# Altium schematic sheet WireCuttingSampling.SchDoc
size A3
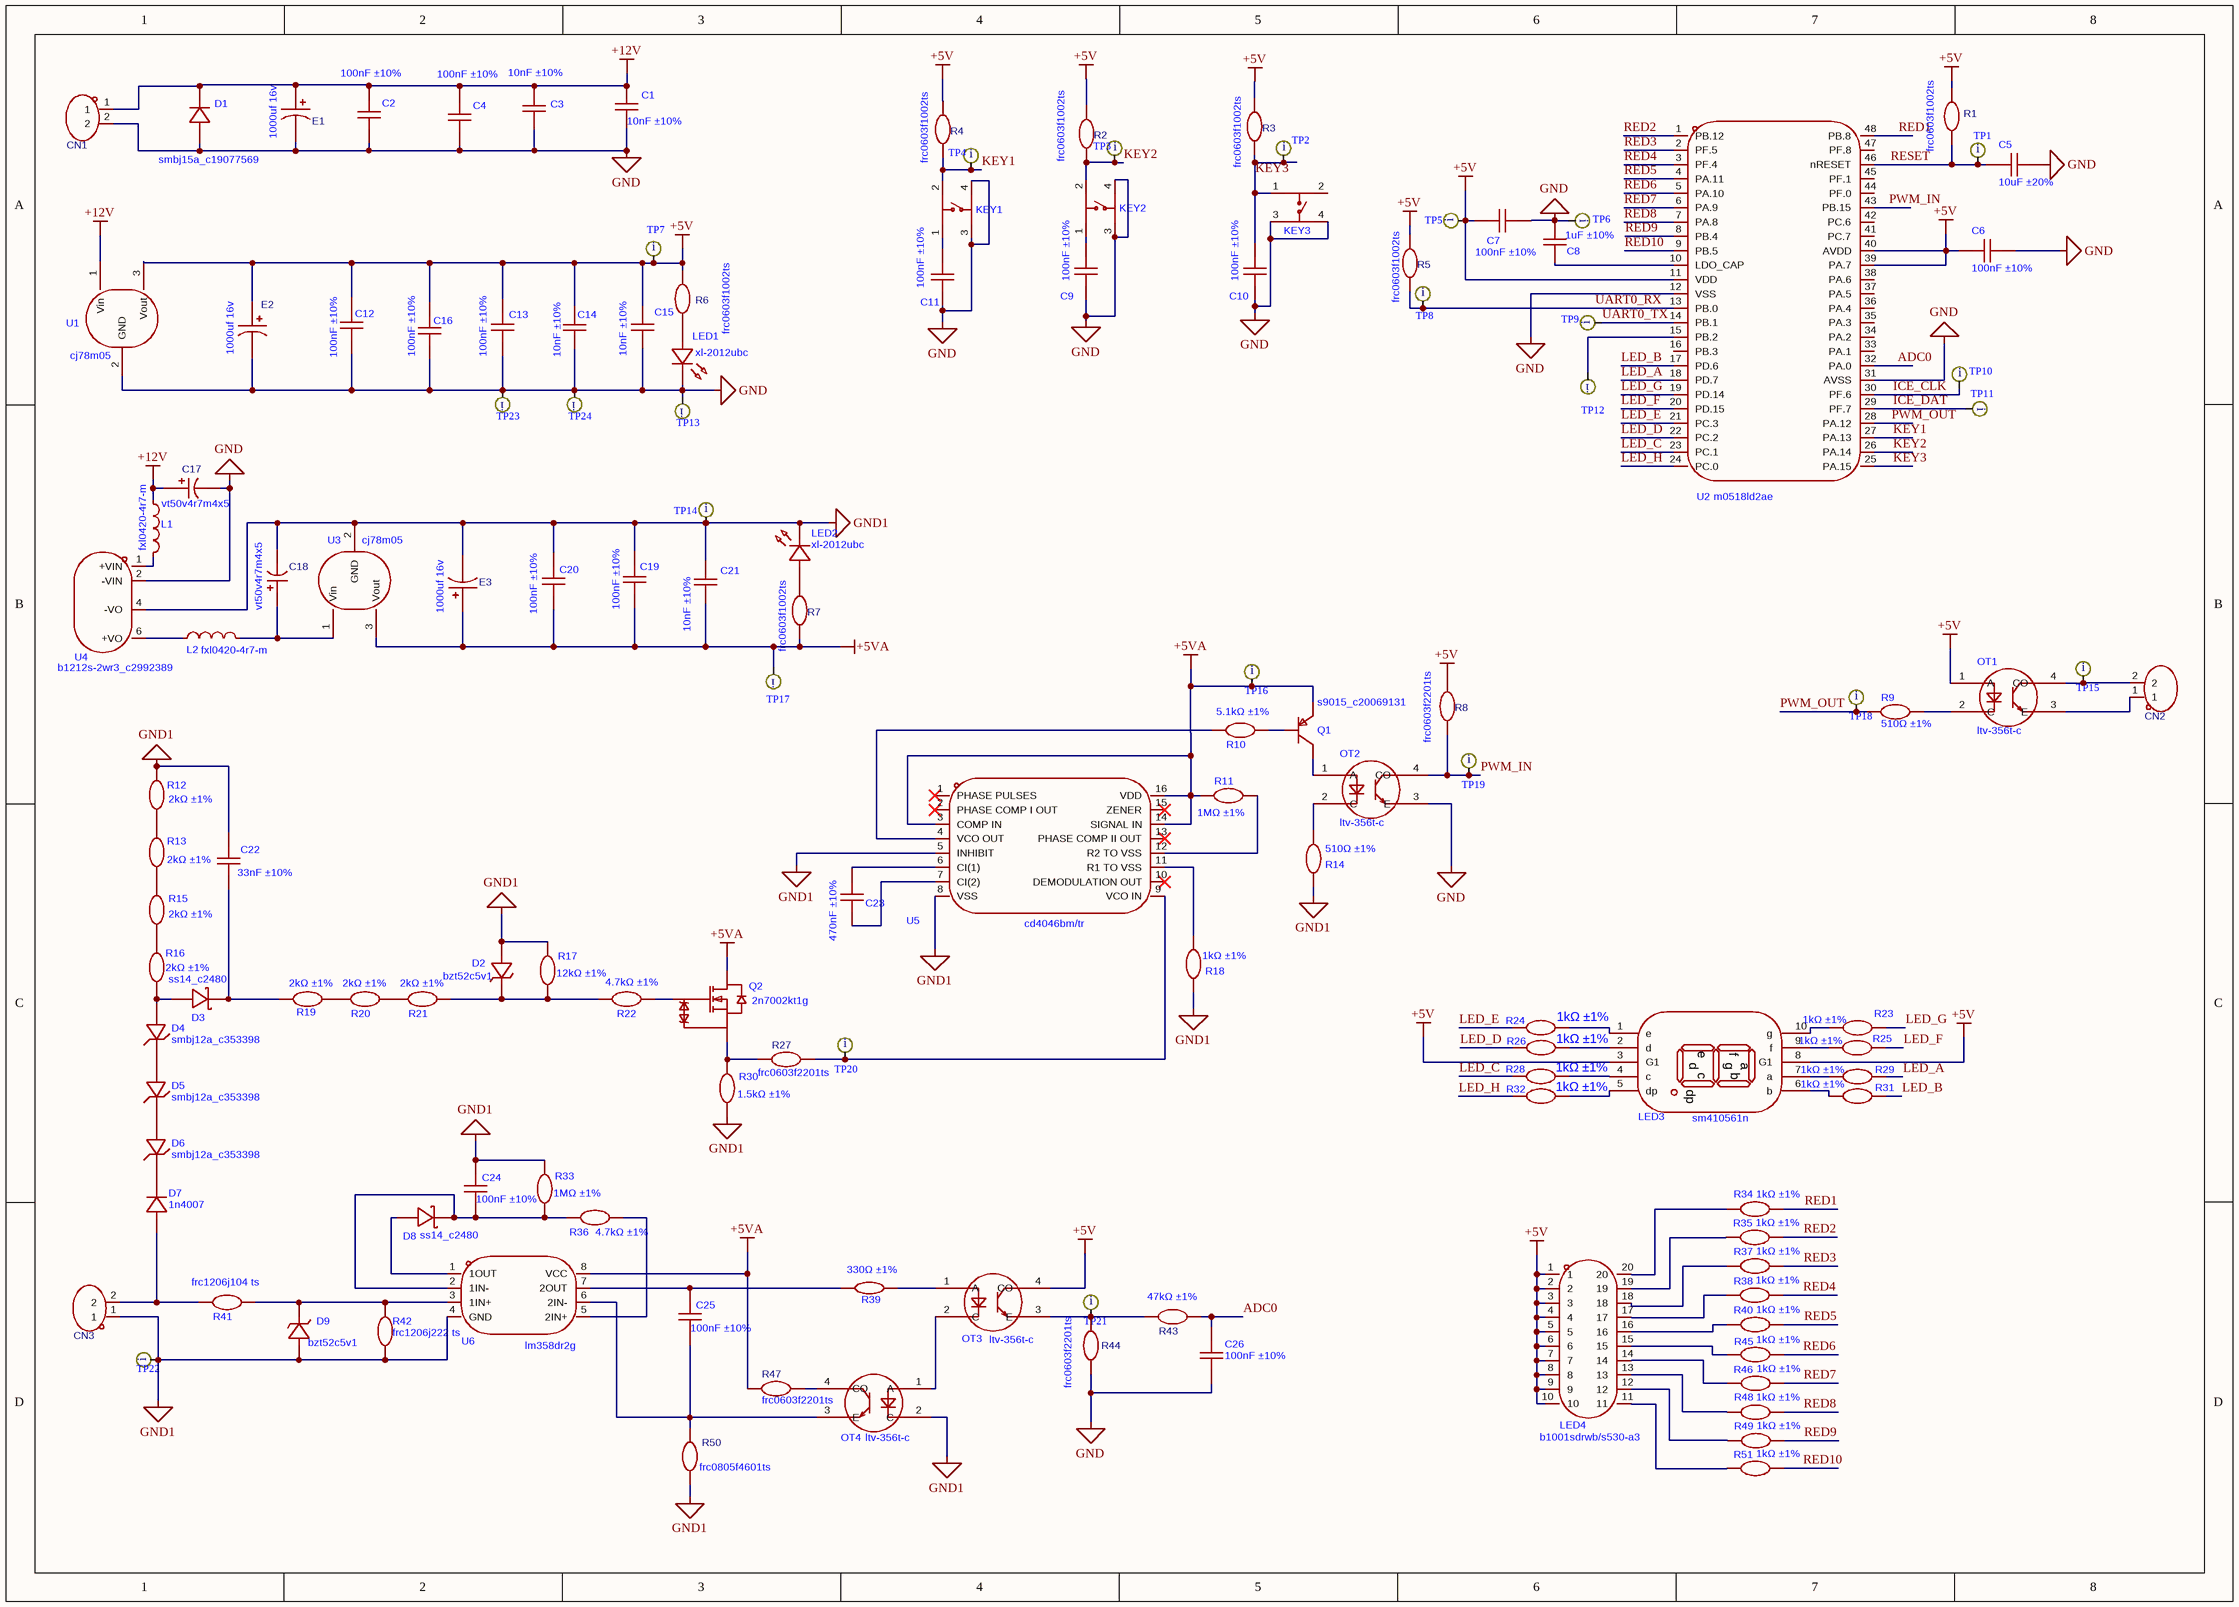
[diagram p0: WireCuttingSampling.SchDoc]

## Parts
C1  10nF ±10%  [C0603]
C2  100nF ±10%  [C0603]
C3  10nF ±10%  [C0603]
C4  100nF ±10%  [C0603]
C5  10uF ±20%  [C0603]
C6  100nF ±10%  [C0603]
C7  100nF ±10%  [C0603]
C8  1uF ±10%  [C0603]
C9  100nF ±10%  [C0603]
C10  100nF ±10%  [C0603]
C11  100nF ±10%  [C0603]
C12  100nF ±10%  [C0603]
C13  100nF ±10%  [C0603]
C14  10nF ±10%  [C0603]
C15  10nF ±10%  [C0603]
C16  100nF ±10%  [C0603]
C17  vt50v4r7m4x5  [CAP-SMD_BD4.0-L4.3-W4.3-LS5.0-FD]
C18  vt50v4r7m4x5  [CAP-SMD_BD4.0-L4.3-W4.3-LS5.0-FD]
C19  100nF ±10%  [C0603]
C20  100nF ±10%  [C0603]
C21  10nF ±10%  [C0603]
C22  33nF ±10%  [CAP-TH_L12.0-W5.0-P10.00-D0.6-1]
C23  470nF ±10%  [C0603]
C24  100nF ±10%  [C0603]
C25  100nF ±10%  [C0603]
C26  100nF ±10%  [C0603]
CN1  wj15edgvc-3.81-02p-14-00a  [CONN-TH_WJ15EDGVC-3.81-2P]  (value not drawn)
CN2  wj15edgvc-3.81-02p-14-00a  [CONN-TH_WJ15EDGVC-3.81-2P]  (value not drawn)
CN3  wj15edgvc-3.81-02p-14-00a  [CONN-TH_WJ15EDGVC-3.81-2P]  (value not drawn)
D1  smbj15a_c19077569  [SMB_L4.3-W3.6-LS5.3-RD]
D2  bzt52c5v1  [SOD-123_L2.7-W1.6-LS3.7-RD]
D3  ss14_c2480  [SMA_L4.2-W2.6-LS5.0-RD_1]
D4  smbj12a_c353398  [SMB_L4.6-W3.6-LS5.3-RD]
D5  smbj12a_c353398  [SMB_L4.6-W3.6-LS5.3-RD]
D6  smbj12a_c353398  [SMB_L4.6-W3.6-LS5.3-RD]
D7  1n4007  [SMA_L4.3-W2.5-LS5.0-RD]
D8  ss14_c2480  [SMA_L4.2-W2.6-LS5.0-RD_1]
D9  bzt52c5v1  [SOD-123_L2.7-W1.6-LS3.7-RD]
E1  1000uf 16v  [CAP-SMD_BD10.0-L10.3-W10.3-FD]
E2  1000uf 16v  [CAP-SMD_BD10.0-L10.3-W10.3-FD]
E3  1000uf 16v  [CAP-SMD_BD10.0-L10.3-W10.3-FD]
KEY1  b3f-4055_c84931  [KEY-TH_4P-L12.0-W12.0-P5.00-LS13.4-EH]  (value not drawn)
KEY2  b3f-4055_c84931  [KEY-TH_4P-L12.0-W12.0-P5.00-LS13.4-EH]  (value not drawn)
KEY3  b3f-4055_c84931  [KEY-TH_4P-L12.0-W12.0-P5.00-LS13.4-EH]  (value not drawn)
L1  fxl0420-4r7-m  [IND-SMD_L4.4-W4.2]
L2  fxl0420-4r7-m  [IND-SMD_L4.4-W4.2]
LED1  xl-2012ubc  [LED0805-RD]
LED2  xl-2012ubc  [LED0805-RD]
LED3  sm410561n  [LED-SEG-TH_10P-L12.7-W19.0-P2.54-S15.24-BL]
LED4  b1001sdrwb/s530-a3  [LED-SEG-TH_20P-L25.3-W10.1-P2.54-S7.6-BL]
OT1  ltv-356t-c  [SOP-4_L3.9-W4.4-P2.54-LS7.0-TL]
OT2  ltv-356t-c  [SOP-4_L3.9-W4.4-P2.54-LS7.0-TL]
OT3  ltv-356t-c  [SOP-4_L3.9-W4.4-P2.54-LS7.0-TL]
OT4  ltv-356t-c  [SOP-4_L3.9-W4.4-P2.54-LS7.0-TL]
Q1  s9015_c20069131  [SOT-23-3_L2.9-W1.3-P0.95-LS2.4-BR]
Q2  2n7002kt1g  [SOT-23-3_L2.9-W1.3-P1.90-LS2.4-BR]
R1  frc0603f1002ts  [R0603]
R2  frc0603f1002ts  [R0603]
R3  frc0603f1002ts  [R0603]
R4  frc0603f1002ts  [R0603]
R5  frc0603f1002ts  [R0603]
R6  frc0603f1002ts  [R0603]
R7  frc0603f1002ts  [R0603]
R8  frc0603f2201ts  [R0603]
R9  510Ω ±1%  [R0603]
R10  5.1kΩ ±1%  [R0603]
R11  1MΩ ±1%  [R0603]
R12  2kΩ ±1%  [R2010]
R13  2kΩ ±1%  [R2010]
R14  510Ω ±1%  [R0603]
R15  2kΩ ±1%  [R2010]
R16  2kΩ ±1%  [R2010]
R17  12kΩ ±1%  [R2010]
R18  1kΩ ±1%  [R0603]
R19  2kΩ ±1%  [R2010]
R20  2kΩ ±1%  [R2010]
R21  2kΩ ±1%  [R2010]
R22  4.7kΩ ±1%  [R1206]
R23  1kΩ ±1%  [R0603]
R24  1kΩ ±1%  [R0603]
R25  1kΩ ±1%  [R0603]
R26  1kΩ ±1%  [R0603]
R27  frc0603f2201ts  [R0603]
R28  1kΩ ±1%  [R0603]
R29  1kΩ ±1%  [R0603]
R30  1.5kΩ ±1%  [R0603]
R31  1kΩ ±1%  [R0603]
R32  1kΩ ±1%  [R0603]
R33  1MΩ ±1%  [R0603]
R34  1kΩ ±1%  [R0603]
R35  1kΩ ±1%  [R0603]
R36  4.7kΩ ±1%  [R1206]
R37  1kΩ ±1%  [R0603]
R38  1kΩ ±1%  [R0603]
R39  330Ω ±1%  [R0603]
R40  1kΩ ±1%  [R0603]
R41  frc1206j104 ts  [R1206]
R42  frc1206j222 ts  [R1206]
R43  47kΩ ±1%  [R0603]
R44  frc0603f2201ts  [R0603]
R45  1kΩ ±1%  [R0603]
R46  1kΩ ±1%  [R0603]
R47  frc0603f2201ts  [R0603]
R48  1kΩ ±1%  [R0603]
R49  1kΩ ±1%  [R0603]
R50  frc0805f4601ts  [R0805]
R51  1kΩ ±1%  [R0603]
TP1  TP  [TP]  (value not drawn)
TP2  TP  [TP]  (value not drawn)
TP3  TP  [TP]  (value not drawn)
TP4  TP  [TP]  (value not drawn)
TP5  TP  [TP]  (value not drawn)
TP6  TP  [TP]  (value not drawn)
TP7  TP  [TP]  (value not drawn)
TP8  TP  [TP]  (value not drawn)
TP9  TP  [TP]  (value not drawn)
TP10  TP  [TP]  (value not drawn)
TP11  TP  [TP]  (value not drawn)
TP12  TP  [TP]  (value not drawn)
TP13  TP  [TP]  (value not drawn)
TP14  TP  [TP]  (value not drawn)
TP15  TP  [TP]  (value not drawn)
TP16  TP  [TP]  (value not drawn)
TP17  TP  [TP]  (value not drawn)
TP18  TP  [TP]  (value not drawn)
TP19  TP  [TP]  (value not drawn)
TP20  TP  [TP]  (value not drawn)
TP21  TP  [TP]  (value not drawn)
TP22  TP  [TP]  (value not drawn)
TP23  TP  [TP]  (value not drawn)
TP24  TP  [TP]  (value not drawn)
U1  cj78m05  [TO-252-3_L6.5-W5.8-P4.58-TL]
U2  m0518ld2ae  [LQFP-48_L7.0-W7.0-P0.50-LS9.0-BL]
U3  cj78m05  [TO-252-3_L6.5-W5.8-P4.58-TL]
U4  b1212s-2wr3_c2992389  [PWRM-TH_4P-L19.7-W7.1-P2.54_DEXU_NN2-12S05CN]
U5  cd4046bm/tr  [SOP-16_L9.9-W3.9-P1.27-LS6.0-BL]
U6  lm358dr2g  [SOIC-8_L5.0-W4.0-P1.27-LS6.0-BL]

## Nets
+5V: C6.2 C7.1 C12.2 C13.2 C14.2 C15.2 C16.2 E2.1 LED3.3(G1) LED3.8(G1) LED4.1 LED4.2 LED4.3 LED4.4 LED4.5 LED4.6 LED4.7 LED4.8 LED4.9 LED4.10 OT1.1(A) OT3.4(CO) R1.2 R2.2 R3.2 R4.2 R5.2 R6.2 R8.2 TP5.1(VDD) TP7.1(VDD) U1.3(Vout) U2.11(VDD) U2.39(PA.7) U2.40(AVDD)
+5VA: C19.1 C20.1 C21.1 E3.1 Q1.2(E) Q2.3(D) R7.1 R11.2 R47.2 TP16.1(VDD) TP17.1(VDD) U3.3(Vout) U5.3(COMP_IN) U5.14(SIGNAL_IN) U5.16(VDD) U6.8(VCC)
+12V: C1.2 C2.2 C3.2 C4.2 C17.1 CN1.1 D1.1(K) E1.1 L1.1 U1.1(Vin)
GND: C1.1 C2.1 C3.1 C4.1 C5.1 C6.1 C7.2 C8.1 C9.1 C10.1 C11.1 C12.1 C13.1 C14.1 C15.1 C16.1 C17.2 C26.2 CN1.2 D1.2(A) E1.2 E2.2 KEY1.3 KEY1.4 KEY2.3 KEY2.4 KEY3.3 KEY3.4 LED1.1(K) OT2.3(E) R44.2 TP6.1(VDD) TP13.1(VDD) TP23.1(VDD) TP24.1(VDD) U1.2(GND) U2.12(VSS) U2.31(AVSS) U4.2(-VIN)
GND1: C18.2 C19.2 C20.2 C21.2 C22.2 C24.2 CN3.1 D2.2(A) D9.2(A) E3.2 LED2.1(K) OT4.2(C) R12.2 R14.1 R17.2 R18.1 R30.1 R33.2 R42.1 R50.1 TP14.1(VDD) TP22.1(VDD) U3.2(GND) U4.4(-VO) U5.5(INHIBIT) U5.8(VSS) U6.4(GND)
ADC0: C26.1 R43.2 U2.32(PA.0)
ICE_CLK: TP10.1(VDD) U2.30(PF.6)
ICE_DAT: TP11.1(VDD) U2.29(PF.7)
KEY1: KEY1.2 R4.1 TP4.1(VDD) U2.27(PA.13)
KEY2: KEY2.2 R2.1 TP3.1(VDD) U2.26(PA.14)
KEY3: C10.2 KEY3.1 R3.1 TP2.1(VDD) U2.25(PA.15)
LED_A: R29.1 U2.18(PD.7)
LED_B: R31.1 U2.17(PD.6)
LED_C: R28.1 U2.23(PC.1)
LED_D: R26.2 U2.22(PC.2)
LED_E: R24.2 U2.21(PC.3)
LED_F: R25.2 U2.20(PD.15)
LED_G: R23.2 U2.19(PD.14)
LED_H: R32.1 U2.24(PC.0)
PWM_IN: OT2.4(CO) R8.1 TP19.1(VDD) U2.43(PB.15)
PWM_OUT: R9.2 TP18.1(VDD) U2.28(PA.12)
RED1: R34.2 U2.48(PB.8)
RED2: R35.2 U2.1(PB.12)
RED3: R37.2 U2.2(PF.5)
RED4: R38.2 U2.3(PF.4)
RED5: R40.2 U2.4(PA.11)
RED6: R45.2 U2.5(PA.10)
RED7: R46.2 U2.6(PA.9)
RED8: R48.2 U2.7(PA.8)
RED9: R49.2 U2.8(PB.4)
RED10: R51.2 U2.9(PB.5)
RESET: C5.2 R1.1 TP1.1(VDD) U2.46(nRESET)
UART0_RX: R5.1 TP8.1(VDD) U2.13(PB.0)
UART0_TX: TP9.1(VDD) U2.14(PB.1)
NetC8_2: C8.2 U2.10(LDO_CAP)
NetC9_2: C9.2 KEY2.1
NetC11_2: C11.2 KEY1.1
NetC18_1: C18.1 L2.2 U3.1(Vin)
NetC22_1: C22.1 D3.1(K) R19.2
NetC23_1: C23.1 U5.7(CI(2))
NetC23_2: C23.2 U5.6(CI(1))
NetC24_1: C24.1 D8.1(K) R33.1 R36.1 U6.2(1IN-)
NetC25_1: C25.1 OT4.3(E) R50.2 U6.6(2IN-)
NetC25_2: C25.2 R39.1 U6.7(2OUT)
NetCN2_1: CN2.1 OT1.3(E)
NetCN2_2: CN2.2 OT1.4(CO) TP15.1(VDD)
NetCN3_2: CN3.2 D7.2(A) R41.1
NetD2_1: D2.1(K) R17.1 R21.1 R22.1
NetD3_2: D3.2(A) D4.2(A) R16.1
NetD4_1: D4.1(C) D5.2(A)
NetD5_1: D5.1(C) D6.2(A)
NetD6_1: D6.1(C) D7.1(K)
NetD8_2: D8.2(A) U6.1(1OUT)
NetD9_1: D9.1(K) R41.2 R42.2 U6.3(1IN+)
NetL1_2: L1.2 U4.1(+VIN)
NetL2_1: L2.1 U4.6(+VO)
NetLED1_2: LED1.2(A) R6.1
NetLED2_2: LED2.2(A) R7.2
NetLED3_1: LED3.1(e) R24.1
NetLED3_2: LED3.2(d) R26.1
NetLED3_4: LED3.4(c) R28.2
NetLED3_5: LED3.5(dp) R32.2
NetLED3_6: LED3.6(b) R31.2
NetLED3_7: LED3.7(a) R29.2
NetLED3_9: LED3.9(f) R25.1
NetLED3_10: LED3.10(g) R23.1
NetLED4_11: LED4.11 R51.1
NetLED4_12: LED4.12 R49.1
NetLED4_13: LED4.13 R48.1
NetLED4_14: LED4.14 R46.1
NetLED4_15: LED4.15 R45.1
NetLED4_16: LED4.16 R40.1
NetLED4_17: LED4.17 R38.1
NetLED4_18: LED4.18 R37.1
NetLED4_19: LED4.19 R35.1
NetLED4_20: LED4.20 R34.1
NetOT1_2: OT1.2(C) R9.1
NetOT2_1: OT2.1(A) Q1.3(C)
NetOT2_2: OT2.2(C) R14.2
NetOT3_1: OT3.1(A) R39.2
NetOT3_2: OT3.2(C) OT4.1(A)
NetOT3_3: OT3.3(E) R43.1 R44.1 TP21.1(VDD)
NetOT4_4: OT4.4(CO) R47.1
NetQ1_1: Q1.1(B) R10.2
NetQ2_1: Q2.1(G) R22.2
NetQ2_2: Q2.2(S) R27.2 R30.2
NetR10_1: R10.1 U5.4(VCO_OUT)
NetR11_1: R11.1 U5.12(R2_TO_VSS)
NetR12_1: R12.1 R13.2
NetR13_1: R13.1 R15.2
NetR15_1: R15.1 R16.2
NetR18_2: R18.2 U5.11(R1_TO_VSS)
NetR19_1: R19.1 R20.2
NetR20_1: R20.1 R21.2
NetR27_1: R27.1 TP20.1(VDD) U5.9(VCO_IN)
NetR36_2: R36.2 U6.5(2IN+)
NetTP12_1: TP12.1(VDD) U2.15(PB.2)

Not connected (* = marked no-connect by the designer): KEY3 2; U2 16(PB.3) 33(PA.1) 34(PA.2) 35(PA.3) 36(PA.4) 37(PA.5) 38(PA.6) 41(PC.7) 42(PC.6) 44(PF.0) 45(PF.1) 47(PF.8); U5 1(PHASE_PULSES)* 2(PHASE_COMP_I_OUT)* 10(DEMODULATION_OUT)* 13(PHASE_COMP_II_OUT)* 15(ZENER)*

## Notes on the sheet
- (in symbol TP) i

## Library data of the parts
C1 C3 C14 C15 C21 = cc0603krx7r9bb103: 容值:10nF;精度:±10%;额定电压:50V;温度系数:X7R;; Manufacturer: YAGEO(国巨); AddInBom: yes; ModelId: ac125912035d415993ca9572d50418b1; ModelName: C0603_L1.6-W0.8-H0.8; ModelTransform: 62.992,31.496,0,0,0,0,0,0,0; Voltage Rating: 50V; Temperature Coefficient: X7R; Symbol: CC0603KRX7R9BB103; LCSC Part Name: 10nF ±10% 50V; SupplierPart: C100042; ManufacturerPart: CC0603KRX7R9BB103; Supplier Footprint: 0603; JLCPCB Part Class: Extended Part; Datasheet: https://item.szlcsc.com/datasheet/CC0603KRX7R9BB103/101256.html; Supplier: LCSC; ConvertToPcb: yes; FootprintName: C0603; Value: 10nF; Tolerance: ±10%
C2 C4 C6 C7 C9-C13 C16 C19 C20 C24-C26 = cl10b104kb8nnnc: 容值:100nF;精度:±10%;额定电压:50V;温度系数:X7R;; Manufacturer: SAMSUNG(三星); AddInBom: yes; ModelId: ac125912035d415993ca9572d50418b1; ModelName: C0603_L1.6-W0.8-H0.8; ModelTransform: 62.992,31.496,0,0,0,0,0,0,0; Voltage Rating: 50V; Temperature Coefficient: X7R; Symbol: CL10B104KB8NNNC; LCSC Part Name: 100nF ±10% 50V; SupplierPart: C1591; ManufacturerPart: CL10B104KB8NNNC; Supplier Footprint: 0603; JLCPCB Part Class: Extended Part; Datasheet: https://item.szlcsc.com/datasheet/CL10B104KB8NNNC/1943.html; Supplier: LCSC; ConvertToPcb: yes; FootprintName: C0603; Value: 100nF; Tolerance: ±10%
C5 = hgc0603r5106m160nthj: 容值:10uF;精度:±20%;额定电压:16V;温度系数:X5R;; Manufacturer: Chinocera(华瓷); AddInBom: yes; ModelId: ac125912035d415993ca9572d50418b1; ModelName: C0603_L1.6-W0.8-H0.8; ModelTransform: 62.992,31.496,0,0,0,0,0,0,0; Voltage Rating: 16V; Temperature Coefficient: X5R; Symbol: HGC0603R5106M160NTHJ; LCSC Part Name: 10uF ±20% 16V; SupplierPart: C7472959; ManufacturerPart: HGC0603R5106M160NTHJ; Supplier Footprint: 0603; JLCPCB Part Class: Extended Part; Datasheet: https://item.szlcsc.com/datasheet/HGC0603R5106M160NTHJ/8532806.html; Supplier: LCSC; ConvertToPcb: yes; FootprintName: C0603; Value: 10uF; Tolerance: ±20%
C8 = cl10a105ko8nnnc: 容值:1uF;精度:±10%;额定电压:16V;温度系数:X5R;; Manufacturer: SAMSUNG(三星); AddInBom: yes; ModelId: ac125912035d415993ca9572d50418b1; ModelName: C0603_L1.6-W0.8-H0.8; ModelTransform: 62.992,31.496,0,0,0,0,0,0,0; Voltage Rating: 16V; Temperature Coefficient: X5R; Symbol: CL10A105KO8NNNC; LCSC Part Name: 1uF ±10% 16V; SupplierPart: C1592; ManufacturerPart: CL10A105KO8NNNC; Supplier Footprint: 0603; JLCPCB Part Class: Extended Part; Datasheet: https://item.szlcsc.com/datasheet/CL10A105KO8NNNC/1944.html; Supplier: LCSC; ConvertToPcb: yes; FootprintName: C0603; Value: 1uF; Tolerance: ±10%
C17 C18 = vt50v4r7m4x5: 容值:4.7uF;精度:±20%;额定电压:50V;纹波电流:13mA@120Hz;; Manufacturer: JIERR(捷而瑞); AddInBom: yes; ModelId: d5abac2407cc4bb7a22453350802a0e2; ModelName: CAP-SMD_L4.3-W4.3-H5.3-LS5.1; ModelTransform: 169.291,181.102,0,90,0,0,0.376,-0.001,0; Value: 4.7uF; Tolerance: ±20%; Voltage Rating: 50V; Lifetime: 2000hrs@105℃; Symbol: VT50V4R7M4X5; LCSC Part Name: 4.7uF ±20% 50V; SupplierPart: C48970985; ManufacturerPart: VT50V4R7M4X5; Supplier Footprint: SMD,D4xL5.4mm; JLCPCB Part Class: Extended Part; Datasheet: https://item.szlcsc.com/datasheet/VT50V4R7M4X5/51296190.html; Supplier: LCSC; ConvertToPcb: yes; FootprintName: CAP-SMD_BD4.0-L4.3-W4.3-LS5.0-FD; Ripple Current: 13mA@120Hz; Diameter: 4mm; Height - Seated (Max): 5.4mm; Operating Temperature: -40℃~+105℃
C22 = mpx333k31c2kn15600: 容值:33nF;精度:±10%;工作电压(AC):275V；310V；305V;防护等级:X2;; Manufacturer: KNSCHA(科尼盛); AddInBom: yes; ModelId: a949099525614742aa1b794542c34fa9; ModelTransform: 472.44,196.85,0,0,0,0,0,0,-137.795; Ratings: X2; safety certification: UL；CUL；KC；ENEC；VDE；CQC; Symbol: MPX333K31C2KN15600; LCSC Part Name: 33nF ±10% 275V 305V 310V 等级:X2; SupplierPart: C489092; ManufacturerPart: MPX333K31C2KN15600; Supplier Footprint: 插件,P=10mm; JLCPCB Part Class: Extended Part; Datasheet: https://item.szlcsc.com/datasheet/MPX333K31C2KN15600/498791.html; Supplier: LCSC; ConvertToPcb: yes; FootprintName: CAP-TH_L12.0-W5.0-P10.00-D0.6-1; ModelName: CAP-TH_L12.0-W5.0-P10.00-D0.6-1; Value: 33nF; Tolerance: ±10%; Voltage(AC): 275V；310V；305V; Operating Temperature: -40℃~+110℃
C23 = cc0603krx7r9bb474: 容值:470nF;精度:±10%;额定电压:50V;温度系数:X7R;; Manufacturer: YAGEO(国巨); AddInBom: yes; ModelId: ac125912035d415993ca9572d50418b1; ModelName: C0603_L1.6-W0.8-H0.8; ModelTransform: 62.992,31.496,0,0,0,0,0,0,0; Voltage Rating: 50V; Temperature Coefficient: X7R; Symbol: CC0603KRX7R9BB474; LCSC Part Name: 470nF ±10% 50V; SupplierPart: C513577; ManufacturerPart: CC0603KRX7R9BB474; Supplier Footprint: 0603; JLCPCB Part Class: Extended Part; Datasheet: https://item.szlcsc.com/datasheet/CC0603KRX7R9BB474/528404.html; Supplier: LCSC; ConvertToPcb: yes; FootprintName: C0603; Value: 470nF; Tolerance: ±10%
CN1-CN3 = wj15edgvc-3.81-02p-14-00a: 连接器类型:板端/插座-闭口;固定方式:-;结构:1x2P;间距:3.81mm;颜色:绿色;安装方式:直插;排数:1;每排PIN数:2;额定电流:8A;额定电压:300V;线规 - AWG:-;线规 - 平方毫米:-;工作温度:-40℃~+105℃;; Manufacturer: KANGNEX(康奈克斯电气); Symbol: WJ15EDGVC-3.81-2P; AddInBom: yes; ModelId: 4fb8508385d5450abf2abd114199f87c; ModelName: CONN-TH_DB3.81-LI-2P; ModelTransform: 334.645,275.629,0,180,0,0,0,-27.559,-145.669; Number of Positions or Pins: 1x2P; Pitch: 3.81mm; Number of PINs Per Row: 2; Current Rating: 8A; Voltage Rating (Max): 300V; LCSC Part Name: 1x2P 3.81mm 排数:1 每排P数:2; SupplierPart: C8396; ManufacturerPart: WJ15EDGVC-3.81-02P-14-00A; Supplier Footprint: 插件,P=3.81mm; JLCPCB Part Class: Extended Part; Datasheet: https://item.szlcsc.com/datasheet/WJ15EDGVC-3.81-02P-14-00A/8890.html; Supplier: LCSC; ConvertToPcb: yes; FootprintName: CONN-TH_WJ15EDGVC-3.81-2P; Connector Type: 板端/插座-闭口; Termination Style: -; Color: 绿色; Mounting Type: 直插; Number of Pins: 2P; Number of Rows: 1; Wire Gauge - AWG: -; Wire Gauge - mm2: -; Operating Temperature: -40℃~+105℃; Connection Type: -; Outlet Direction (Vertical Basis): -
D1 = smbj15a_c19077569: 极性:单向;反向截止电压(Vrwm):15V;钳位电压:24.4V;峰值脉冲电流(Ipp):24.59A@10/1000us;峰值脉冲功率(Ppp):600W@10/1000us;击穿电压:18.5V;; Manufacturer: R+O(宏嘉诚); AddInBom: yes; ModelId: c889f7f4bb1d4007adeb7906fc7ccf08; ModelName: SMB_L4.32-W3.62-LS5.3-RD; ModelTransform: 208.661,142.5194,0,0,0,0,0,0,0; Polarity: 单向; Reverse Stand-Off Voltage (Vrwm): 15V; Clamping Voltage: 24.4V; Voltage - Breakdown: 18.5V; Reverse Leakage Current (Ir): 5uA; level of protection: IEC 61000-4-2; Type: TVS; Symbol: SMBJ15A_C19077569; LCSC Part Name: 单向TVS 15V截止 峰值浪涌电流：24.59A@10/1000us; SupplierPart: C19077569; ManufacturerPart: SMBJ15A; Supplier Footprint: DO-214AA(SMB); JLCPCB Part Class: Extended Part; Datasheet: https://item.szlcsc.com/datasheet/SMBJ15A/20275654.html; Supplier: LCSC; ConvertToPcb: yes; FootprintName: SMB_L4.3-W3.6-LS5.3-RD; Peak Pulse Current (Ipp): 24.59A@10/1000us; Peak Pulse Power Dissipation (Ppp): 600W@10/1000us; Operating Temperature: -55℃~+150℃
D2 D9 = bzt52c5v1_c19077401: 二极管配置:1个独立式;稳压值(标称值):5.1V;稳压值(范围):4.85V~5.36V;耗散功率(Pd):350mW;; Manufacturer: R+O(宏嘉诚); AddInBom: yes; ModelId: ad7e39f9e5534b3c96ffdc5532ebb493; ModelName: SOD-123_L2.7-W1.6-H1.4-LS3.7; ModelTransform: 146.026,62.992,0,180,0,0,0.0005,0,0; Diode Configuration: 1个独立式; Zener Voltage(Nom): 5.1V; Reverse Leakage Current (Ir): 2uA; Pd - Power Dissipation: 350mW; Impedance(Zzt): 60Ω; Impedance(Zzk): 480Ω; Operating Junction Temperature Range: -55℃~+150℃; Symbol: BZT52C5V1_C19077401; LCSC Part Name: 表面贴装齐纳二极管; SupplierPart: C19077401; ManufacturerPart: BZT52C5V1; Supplier Footprint: SOD-123; JLCPCB Part Class: Extended Part; Datasheet: https://item.szlcsc.com/datasheet/BZT52C5V1/20275486.html; Supplier: LCSC; ConvertToPcb: yes; FootprintName: SOD-123_L2.7-W1.6-LS3.7-RD; Zener Voltage(Range): 4.85V~5.36V; Tolerance: -
D3 D8 = ss14_c2480: 二极管配置:独立式;正向压降(Vf):550mV@1A;直流反向耐压(Vr):40V;整流电流:1A;; Manufacturer: MDD(辰达半导体); Symbol: SS14; AddInBom: yes; ModelId: 2ad98c37c5614ad18681cbd22e4725e1; ModelTransform: 196.85,101.181,0,0,0,0,0,0,0; Diode Configuration: 独立式; Voltage - DC Reverse(Vr): 40V; Current - Rectified: 1A; Reverse Leakage Current (Ir): 300uA@40V; Operating Junction Temperature Range: -55℃~+150℃; Non-Repetitive Peak Forward Surge Current: 25A; LCSC Part Name: 电压:40V 电流:1A; SupplierPart: C2480; ManufacturerPart: SS14; Supplier Footprint: SMA(DO-214AC); JLCPCB Part Class: Basic Part; Datasheet: https://item.szlcsc.com/datasheet/SS14/2857.html; Supplier: LCSC; ConvertToPcb: yes; FootprintName: SMA_L4.2-W2.6-LS5.0-RD_1; ModelName: SMA_L4.2-W2.6-LS5.0-RD_1; Voltage - Forward(Vf@If): 550mV@1A
D4-D6 = smbj12a_c353398: 反向截止电压(Vrwm):12V;钳位电压:19.9V;峰值脉冲电流(Ipp):30.2A;峰值脉冲功率(Ppp):600W@10/1000us;击穿电压:14.7V;; Manufacturer: 晶导微电子; AddInBom: yes; ModelId: 5e8926c661484ff2a35b83e5ae62aeb9; ModelTransform: 212.598,141.732,0,0,0,0,0,0,0; Reverse Stand-Off Voltage (Vrwm): 12V; Clamping Voltage: 19.9V; Peak Pulse Current (Ipp): 30.2A; Voltage - Breakdown: 14.7V; Reverse Leakage Current (Ir): 1uA; Type: TVS; Junction Capacitance: 390pF; Symbol: SMBJ12A_C353398; LCSC Part Name: TVS 12V截止 峰值浪涌电流：30.2A; SupplierPart: C353398; ManufacturerPart: SMBJ12A; Supplier Footprint: SMB; JLCPCB Part Class: Extended Part; Datasheet: https://item.szlcsc.com/datasheet/SMBJ12A/329147.html; Supplier: LCSC; ConvertToPcb: yes; FootprintName: SMB_L4.6-W3.6-LS5.3-RD; ModelName: SMB_L4.6-W3.6-LS5.3-RD; Peak Pulse Power Dissipation (Ppp): 600W@10/1000us; Operating Temperature: -65℃~+150℃
D7 = 1n4007_c727081: 二极管配置:独立式;正向压降(Vf):1.1V@1A;直流反向耐压(Vr):1kV;整流电流:1A;; Manufacturer: TWGMC(迪嘉); AddInBom: yes; ModelId: 5b53cc1b87a148cc9fa13125be89f948; ModelTransform: 194.8815,98.425,0,0,0,0,0,0,0; Diode Configuration: 独立式; Voltage - DC Reverse(Vr): 1kV; Current - Rectified: 1A; Reverse Leakage Current (Ir): 5uA; Operating Junction Temperature Range: -55℃~+150℃; Symbol: 1N4007_C727081; LCSC Part Name: 1kV 1A; SupplierPart: C727081; ManufacturerPart: 1N4007; Supplier Footprint: SMA(DO-214AC); JLCPCB Part Class: Extended Part; Datasheet: https://item.szlcsc.com/datasheet/1N4007/774186.html; Supplier: LCSC; ConvertToPcb: yes; FootprintName: SMA_L4.3-W2.5-LS5.0-RD; ModelName: SMA_L4.3-W2.5-LS5.0-RD; Voltage - Forward(Vf@If): 1.1V@1A; Non-Repetitive Peak Forward Surge Current: -
E1-E3 = rvt1c102m1010 1000uf 16v: 容值:1000uF;精度:±20%;额定电压:16V;纹波电流:347mA@120Hz;等效串联电阻(ESR):-;; Manufacturer: DMBJ(振宝佳); Symbol: RVT1C102M1010_C970714; AddInBom: yes; ModelId: b23815befd5e4172abc55cc8ac2654de; ModelTransform: 456.692,405.511,0,180,0,0,0,0,0; Tolerance: ±20%; Lifetime: 2800hrs@105℃; LCSC Part Name: 1000uF ±20% 16V; SupplierPart: C970714; ManufacturerPart: RVT1C102M1010 1000UF 16V; Supplier Footprint: SMD,D10xL10.2mm; JLCPCB Part Class: Extended Part; Datasheet: https://item.szlcsc.com/datasheet/RVT1C102M1010%25201000UF%252016V/1060442.html; Supplier: LCSC; ConvertToPcb: yes; FootprintName: CAP-SMD_BD10.0-L10.3-W10.3-FD; ModelName: CAP-SMD_BD10.0-L10.3-W10.3-FD; Value: 1000uF; Voltage Rating: 16V; Ripple Current: 347mA@120Hz; Equivalent Series Resistance(ESR): -; Diameter: 10mm; Height - Seated (Max): 10.2mm; Operating Temperature: -55℃~+105℃
KEY1-KEY3 = b3f-4055_c84931: 电路结构:单刀单掷;按钮形状:矩形按钮;安装方式:直插;开关长度:12mm;开关宽度:12mm;开关高度:7.3mm;触点电流:50mA;额定电压:24V;带灯:-;工作寿命:-;; Manufacturer: OMRON(欧姆龙); AddInBom: yes; ModelId: f5df7606db84426aa31cc381f3ee7a3a; ModelName: KEY-TH_4P-L12.0-W12.0-H7.5-LS12.5-P5.0; ModelTransform: 554.73787,472.44,0,0,0,0,0,0.123,-129.921; Circuit: 单刀单掷; Actuator Style: 矩形按钮; Switch Height: 7.3mm; Contact Current: 50mA; Voltage Rating: 24V; Symbol: B3F-4055; LCSC Part Name: 12*12*7.3mm 直插 轻触开关; SupplierPart: C84931; ManufacturerPart: B3F-4055; Supplier Footprint: 插件-4P,12x12mm; JLCPCB Part Class: Extended Part; Datasheet: https://item.szlcsc.com/datasheet/B3F-4055/86103.html; Supplier: LCSC; ConvertToPcb: yes; FootprintName: KEY-TH_4P-L12.0-W12.0-P5.00-LS13.4-EH; Mounting Type: 直插; Length: 12mm; Width: 12mm; With Lamp: -; Life: -
L1 L2 = fxl0420-4r7-m: 电感值:4.7uH;精度:±20%;额定电流:2.8A;饱和电流(Isat):3A;类型:一体成型电感;; Manufacturer: cjiang(长江微电); AddInBom: yes; ModelId: e9b3d3f4fa134185b54d517730715f16; ModelName: IND-SMD_L4.2-W4.4-H2.0; ModelTransform: 173.228,165.354,0,0,0,0,0,0,0; Value: 4.7uH; Tolerance: ±20%; Current Rating: 2.8A; Current - Saturation(Isat): 3A; DC Resistance(DCR): 105mΩ; Type: 一体成型电感; Symbol: FXL0420-4R7-M; LCSC Part Name: 4.7uH ±20% 3A; SupplierPart: C167208; ManufacturerPart: FXL0420-4R7-M; Supplier Footprint: SMD,4.4x4.2mm; JLCPCB Part Class: Extended Part; Datasheet: https://item.szlcsc.com/datasheet/FXL0420-4R7-M/178591.html; Supplier: LCSC; ConvertToPcb: yes; FootprintName: IND-SMD_L4.4-W4.2
LED1 LED2 = xl-2012ubc: 灯头类型:2.0mmx1.2mm方形灯头;发光颜色:蓝色;正向压降(Vf):3.2V;功率:70mW;正向电流:20mA;波长:460nm~475nm;二极管配置:独立二极管;透镜颜色:无色透明透镜;色温:-;发光强度:260mcd;发光角度:120°;载带方式:正贴;工作温度:-40℃~+85℃;; Manufacturer: XINGLIGHT(成兴光); AddInBom: yes; ModelId: b1c5ed7a4f6e46d3bc6f6cc7c20f3fea; ModelTransform: 79.527,49.2125,0,0,0,0,0,0,0; Illumination Color: 蓝色; Voltage - Forward(Vf): 3.2V; Power(Watts): 70mW; Forward Current: 20mA; Peak Wavelength: 470nm; Diode Configuration: 独立二极管; Lens Color: 无色透明透镜; Luminous Intensity: 260mcd; Viewing Angle: 120°; Symbol: XL-2012UBC; LCSC Part Name: 0805蓝贴片式发光二极管; SupplierPart: C965817; ManufacturerPart: XL-2012UBC; Supplier Footprint: 0805; JLCPCB Part Class: Extended Part; Datasheet: https://item.szlcsc.com/datasheet/XL-2012UBC/1051426.html; Supplier: LCSC; ConvertToPcb: yes; FootprintName: LED0805-RD; ModelName: LED0805-RD; Lamp Holder Type: 2.0mmx1.2mm方形灯头; Wavelength - Dominant: 460nm~475nm; Color Temperature: -; Mounting Style: 正贴; Operating Temperature: -40℃~+85℃
LED3 = sm410561n: 数码管位数:1位;字符尺寸(英寸):0.56;LED极性:共阳极;发光颜色:红色;耗散功率(Pd):50mW;; Manufacturer: ARKLED(方舟); AddInBom: yes; ModelId: 18b7509e039340f0b8556dc4e613bbae; ModelName: LED-SEG-TH_10P-L12.6-W19.0-H8.0-P2.54-S15.24; ModelTransform: 496.062,748.03,0,0,0,0,0,0,-137.795; Number of Characters: 1位; Digit/Alpha Size(inch): 0.56; Display Type: 7段; LED Polarity: 共阳极; Illumination Color: 红色; Light Intensity: 25mcd; Forward Voltage Drop: 2V; Pd - Power Dissipation: 50mW; Symbol: SM410561N; LCSC Part Name: 1位0.56英寸红色数码管 共阳极; SupplierPart: C141368; ManufacturerPart: SM410561N; Supplier Footprint: 插件; JLCPCB Part Class: Extended Part; Datasheet: https://item.szlcsc.com/datasheet/SM410561N/152698.html; Supplier: LCSC; ConvertToPcb: yes; FootprintName: LED-SEG-TH_10P-L12.7-W19.0-P2.54-S15.24-BL; Operating Temperature: -20℃~+80℃; Length: 19mm; Width: 12.6mm; Height: 8mm
LED4 = b1001sdrwb/s530-a3: 数码管位数:-;字符尺寸(英寸):-;LED极性:共阳;发光颜色:深红色;耗散功率(Pd):60mW;; Manufacturer: EVERLIGHT(亿光); AddInBom: yes; ModelId: 42196fd8777949cd84d7c826477aa856; ModelTransform: 996.061,398.0307,0,0,0,0,-0.001,-0.004,-196.85; LED Polarity: 共阳; Illumination Color: 深红色; Light Intensity: 8.9mcd; Forward Voltage Drop: 2V; Pd - Power Dissipation: 60mW; Symbol: B1001SDRWB/S530-A3; LCSC Part Name: 通孔式显示屏; SupplierPart: C22863594; ManufacturerPart: B1001SDRWB/S530-A3; Supplier Footprint: DIP-20; JLCPCB Part Class: Extended Part; Datasheet: https://www.everlight.com.cn/wp-content/plugins/ItemRelationship/product_files/pdf/B1001SDRWB-S530-A3.pdf; Supplier: LCSC; ConvertToPcb: yes; FootprintName: LED-SEG-TH_20P-L25.3-W10.1-P2.54-S7.6-BL; ModelName: LED-SEG-TH_20P-L25.3-W10.1-P2.54-S7.6-BL; Number of Characters: -; Digit/Alpha Size(inch): -; Display Type: -; Operating Temperature: -40℃~+85℃; Length: -; Width: -; Height: -
OT1-OT4 = ltv-356t-c: 输入类型:DC;正向压降(Vf):1.2V;输出电流:50mA;隔离电压(Vrms):3.75kV;直流反向耐压(Vr):6V;负载电压:80V;输出通道数:1;集射极饱和电压(VCE(sat)):200mV@1mA,20mA;; Manufacturer: LITEON(光宝); AddInBom: yes; ModelId: ddaef38cfbc4419f8552fc0322b02100; ModelName: SOP-4_L4.0-W4.4-H2.1-LS7.0-P2.54; ModelTransform: 157.48,275.824,0,270,0,0,0,0,0; Input type: DC; Output Type: 光电三极管; Voltage - Forward(Vf): 1.2V; Output Current: 50mA; Isolation Voltage(Vrms): 3.75kV; Reverse Voltage: 6V; Load Voltage: 80V; Number of Outputs: 1; Rise time: 4us@2mA,100Ω; Fall time: 3us; Current Transfer Ratio (CTR) Minimum: 50%; Current Transfer Ratio (CTR) Maximum/Saturation Value: 600%; Symbol: LTV-356T-C; LCSC Part Name: DC输入 隔离电压(rms):3750V; SupplierPart: C115452; ManufacturerPart: LTV-356T-C; Supplier Footprint: SOP-4-2.54mm; JLCPCB Part Class: Extended Part; Datasheet: https://item.szlcsc.com/datasheet/LTV-356T-C/116700.html; Supplier: LCSC; ConvertToPcb: yes; FootprintName: SOP-4_L3.9-W4.4-P2.54-LS7.0-TL; Vce Saturation(VCE(sat)): 200mV@1mA,20mA; Operating Temperature: -55℃~+110℃; Forward Current(If): 50mA
Q1 = s9015_c20069131: 晶体管类型:PNP;集电极电流(Ic):100mA;集射极击穿电压(Vceo):45V;耗散功率(Pd):200mW;直流电流增益(hFE):200@1.0mA,5.0V;; Manufacturer: R+O(宏嘉诚); ManufacturerPart: S9015; AddInBom: yes; ModelId: c62791f0466c4ae2a892c056b845b0ca; ModelName: SOT-23-3P_L2.9-W1.3-H1.0-LS2.4-P0.95; ModelTransform: 98.425,114.173,0,180,0,0,0.0005,-0.0005,0; type: PNP; Current - Collector(Ic): 100mA; Collector - Emitter Voltage VCEO: 45V; Pd - Power Dissipation: 200mW; Transition frequency(fT): 150MHz; Current - Collector Cutoff: 100nA; Vce Saturation(VCE(sat)): 300mV@100mA,10mA; Emitter-Base Voltage(Vebo): 5V; Symbol: S9015_C20069131; LCSC Part Name: hFE:200-450，丝印:M6 PNP 电流:0.1A 电压:45V; SupplierPart: C20069131; Supplier Footprint: SOT-23; JLCPCB Part Class: Extended Part; Datasheet: https://item.szlcsc.com/datasheet/S9015/21397169.html; Supplier: LCSC; ConvertToPcb: yes; FootprintName: SOT-23-3_L2.9-W1.3-P0.95-LS2.4-BR; DC Current Gain: 200@1.0mA,5.0V; Operating Temperature: -55℃~+150℃
Q2 = 2n7002kt1g: 数量:1个N沟道;漏源电压(Vdss):60V;连续漏极电流(Id):380mA;导通电阻(RDS(on)):2.5Ω@4.5V,200mA;耗散功率(Pd):420mW;阈值电压(Vgs(th)):2.3V@250uA;; Manufacturer: onsemi(安森美); AddInBom: yes; ModelId: c62791f0466c4ae2a892c056b845b0ca; ModelName: SOT-23-3P_L2.9-W1.3-H1.0-LS2.4-P0.95; ModelTransform: 98.425,114.173,0,180,0,0,0.0005,-0.0005,0; Number: 1个N沟道; Drain to Source Voltage: 60V; Current - Continuous Drain(Id): 380mA; Pd - Power Dissipation: 420mW; Gate Charge(Qg): 700pC@4.5V; Input Capacitance(Ciss): 45pF; Type: N沟道; Symbol: 2N7002KT1G; LCSC Part Name: 1个N沟道 耐压:60V 电流:380mA; SupplierPart: C116584; ManufacturerPart: 2N7002KT1G; Supplier Footprint: SOT-23; JLCPCB Part Class: Extended Part; Datasheet: https://item.szlcsc.com/datasheet/2N7002KT1G/117838.html; Supplier: LCSC; ConvertToPcb: yes; FootprintName: SOT-23-3_L2.9-W1.3-P1.90-LS2.4-BR; RDS(on): 2.5Ω@4.5V,200mA; Gate Threshold Voltage (Vgs(th)): 2.3V@250uA; Reverse Transfer Capacitance (Crss@Vds): -; Operating Temperature: -55℃~+150℃; Output Capacitance(Coss): -
R1-R7 = frc0603f1002ts: 电阻类型:厚膜电阻;阻值:10kΩ;精度:±1%;功率:100mW;工作电压:75V;温度系数:±100ppm/℃;; Manufacturer: FOJAN(富捷); AddInBom: yes; ModelId: fc143cca1e79419f9cd78b61e9279f08; ModelTransform: 31.8897,63.7794,0,90,0,0,0,0,0; Value: 10kΩ; Tolerance: ±1%; Power(Watts): 100mW; Voltage-Supply(Max): 75V; Symbol: FRC0603F1002TS; LCSC Part Name: 10kΩ ±1% 100mW 厚膜电阻; SupplierPart: C2906982; ManufacturerPart: FRC0603F1002TS; Supplier Footprint: 0603; JLCPCB Part Class: Extended Part; Datasheet: https://item.szlcsc.com/datasheet/FRC0603F1002TS/3180495.html; Supplier: LCSC; ConvertToPcb: yes; FootprintName: R0603; ModelName: R0603; Type: 厚膜电阻; Temperature Coefficient: ±100ppm/℃; Operating Temperature: -55℃~+155℃
R8 R27 R44 R47 = frc0603f2201ts: 电阻类型:厚膜电阻;阻值:2.2kΩ;精度:±1%;功率:100mW;工作电压:75V;温度系数:±100ppm/℃;; Manufacturer: FOJAN(富捷); AddInBom: yes; ModelId: fc143cca1e79419f9cd78b61e9279f08; ModelTransform: 31.8897,63.7794,0,90,0,0,0,0,0; Value: 2.2kΩ; Tolerance: ±1%; Power(Watts): 100mW; Voltage-Supply(Max): 75V; Symbol: FRC0603F2201TS; LCSC Part Name: 2.2kΩ ±1% 100mW 厚膜电阻; SupplierPart: C2907005; ManufacturerPart: FRC0603F2201TS; Supplier Footprint: 0603; JLCPCB Part Class: Extended Part; Supplier: LCSC; ConvertToPcb: yes; FootprintName: R0603; ModelName: R0603; Type: 厚膜电阻; Temperature Coefficient: ±100ppm/℃; Operating Temperature: -55℃~+155℃
R9 R14 = frc0603f5100ts: 电阻类型:厚膜电阻;阻值:510Ω;精度:±1%;功率:100mW;工作电压:75V;温度系数:±100ppm/℃;; Manufacturer: FOJAN(富捷); AddInBom: yes; ModelId: fc143cca1e79419f9cd78b61e9279f08; ModelTransform: 31.8897,63.7794,0,90,0,0,0,0,0; Power(Watts): 100mW; Voltage-Supply(Max): 75V; Symbol: FRC0603F5100TS; LCSC Part Name: 510Ω ±1% 100mW 厚膜电阻; SupplierPart: C2907048; ManufacturerPart: FRC0603F5100TS; Supplier Footprint: 0603; JLCPCB Part Class: Extended Part; Supplier: LCSC; ConvertToPcb: yes; FootprintName: R0603; ModelName: R0603; Type: 厚膜电阻; Value: 510Ω; Tolerance: ±1%; Temperature Coefficient: ±100ppm/℃; Operating Temperature: -55℃~+155℃
R10 = frc0603f5101ts: 电阻类型:厚膜电阻;阻值:5.1kΩ;精度:±1%;功率:100mW;工作电压:75V;温度系数:±100ppm/℃;; Manufacturer: FOJAN(富捷); AddInBom: yes; ModelId: fc143cca1e79419f9cd78b61e9279f08; ModelTransform: 31.8897,63.7794,0,90,0,0,0,0,0; Power(Watts): 100mW; Voltage-Supply(Max): 75V; Symbol: FRC0603F5101TS; LCSC Part Name: 5.1kΩ ±1% 100mW 厚膜电阻; SupplierPart: C2907044; ManufacturerPart: FRC0603F5101TS; Supplier Footprint: 0603; JLCPCB Part Class: Extended Part; Supplier: LCSC; ConvertToPcb: yes; FootprintName: R0603; ModelName: R0603; Type: 厚膜电阻; Value: 5.1kΩ; Tolerance: ±1%; Temperature Coefficient: ±100ppm/℃; Operating Temperature: -55℃~+155℃
R11 R33 = frc0603f1004ts: 电阻类型:厚膜电阻;阻值:1MΩ;精度:±1%;功率:100mW;工作电压:75V;温度系数:±100ppm/℃;; Manufacturer: FOJAN(富捷); AddInBom: yes; ModelId: fc143cca1e79419f9cd78b61e9279f08; ModelTransform: 31.8897,63.7794,0,90,0,0,0,0,0; Power(Watts): 100mW; Voltage-Supply(Max): 75V; Symbol: FRC0603F1004TS; LCSC Part Name: 1MΩ ±1% 100mW 厚膜电阻; SupplierPart: C2907003; ManufacturerPart: FRC0603F1004TS; Supplier Footprint: 0603; JLCPCB Part Class: Extended Part; Datasheet: https://item.szlcsc.com/datasheet/FRC0603F1004TS/3180516.html; Supplier: LCSC; ConvertToPcb: yes; FootprintName: R0603; ModelName: R0603; Type: 厚膜电阻; Value: 1MΩ; Tolerance: ±1%; Temperature Coefficient: ±100ppm/℃; Operating Temperature: -55℃~+155℃
R12 R13 R15 R16 R19-R21 = 201007f2001t4e: 电阻类型:厚膜电阻;阻值:2kΩ;精度:±1%;功率:750mW;最大工作电压:200V;温度系数:±100ppm/℃;; Manufacturer: UNI-ROYAL(厚声); AddInBom: yes; ModelId: dbc57748ea604fd2b52740a9d4619b5e; ModelName: R2010_L5.0-W2.5-H0.6; ModelTransform: 196.85,98.425,0,0,0,0,0,-0.0005,0; Power(Watts): 750mW; Overload Voltage (Max): 200V; Symbol: 201007F2001T4E; LCSC Part Name: 2kΩ ±1% 750mW 厚膜电阻; SupplierPart: C421898; ManufacturerPart: 201007F2001T4E; Supplier Footprint: 2010; JLCPCB Part Class: Extended Part; Datasheet: https://atta.szlcsc.com/upload/public/pdf/source/20200306/C422600_1E6D84923E4A46A82E41ADD87F860B5C.pdf; Supplier: LCSC; ConvertToPcb: yes; FootprintName: R2010; Type: 厚膜电阻; Value: 2kΩ; Tolerance: ±1%; Temperature Coefficient: ±100ppm/℃; Operating Temperature Range: -55℃~+155℃
R17 = cq1007f1202t4e: 电阻类型:厚膜电阻;阻值:12kΩ;精度:±1%;功率:750mW;工作电压:200V;温度系数:±100ppm/℃;; Manufacturer: UNI-ROYAL(厚声); AddInBom: yes; ModelId: dbc57748ea604fd2b52740a9d4619b5e; ModelName: R2010_L5.0-W2.5-H0.6; ModelTransform: 196.85,98.425,0,0,0,0,0,-0.0005,0; Power(Watts): 750mW; Voltage-Supply(Max): 200V; Symbol: CQ1007F1202T4E; LCSC Part Name: 厚膜电阻 12kΩ ±1% 750mW 汽车级晶片电阻器; SupplierPart: C966294; ManufacturerPart: CQ1007F1202T4E; Supplier Footprint: 2010; JLCPCB Part Class: Extended Part; Datasheet: https://item.szlcsc.com/datasheet/CQ1007F1202T4E/1052162.html; Supplier: LCSC; ConvertToPcb: yes; FootprintName: R2010; Type: 厚膜电阻; Value: 12kΩ; Tolerance: ±1%; Temperature Coefficient: ±100ppm/℃; Operating Temperature: -55℃~+155℃
R18 R23-R26 R28 R29 R31 R32 R34 R35 R37 R38 R40 R45 R46 R48 R49 R51 = frc0603f1001ts: 电阻类型:厚膜电阻;阻值:1kΩ;精度:±1%;功率:100mW;工作电压:75V;温度系数:±100ppm/℃;; Manufacturer: FOJAN(富捷); AddInBom: yes; ModelId: fc143cca1e79419f9cd78b61e9279f08; ModelTransform: 31.8897,63.7794,0,90,0,0,0,0,0; Power(Watts): 100mW; Voltage-Supply(Max): 75V; Symbol: FRC0603F1001TS; LCSC Part Name: 1kΩ ±1% 100mW 厚膜电阻; SupplierPart: C2907002; ManufacturerPart: FRC0603F1001TS; Supplier Footprint: 0603; JLCPCB Part Class: Extended Part; Supplier: LCSC; ConvertToPcb: yes; FootprintName: R0603; ModelName: R0603; Type: 厚膜电阻; Value: 1kΩ; Tolerance: ±1%; Temperature Coefficient: ±100ppm/℃; Operating Temperature: -55℃~+155℃
R22 R36 = frc1206f4701ts: 电阻类型:厚膜电阻;阻值:4.7kΩ;精度:±1%;功率:250mW;工作电压:200V;温度系数:±100ppm/℃;; Manufacturer: FOJAN(富捷); AddInBom: yes; ModelId: 89a1f13db2384da588040e0b3c55bf66; ModelName: R1206_L3.2-W1.6-H0.6; ModelTransform: 125.984,62.992,0,0,0,0,0,0,0; Power(Watts): 250mW; Voltage-Supply(Max): 200V; Symbol: FRC1206F4701TS; LCSC Part Name: 4.7kΩ ±1% 250mW 厚膜电阻; SupplierPart: C2907387; ManufacturerPart: FRC1206F4701TS; Supplier Footprint: 1206; JLCPCB Part Class: Extended Part; Supplier: LCSC; ConvertToPcb: yes; FootprintName: R1206; Type: 厚膜电阻; Value: 4.7kΩ; Tolerance: ±1%; Temperature Coefficient: ±100ppm/℃; Operating Temperature: -55℃~+155℃
R30 = frc0603f1501ts: 电阻类型:厚膜电阻;阻值:1.5kΩ;精度:±1%;功率:100mW;工作电压:75V;温度系数:±100ppm/℃;; Manufacturer: FOJAN(富捷); AddInBom: yes; ModelId: fc143cca1e79419f9cd78b61e9279f08; ModelTransform: 31.8897,63.7794,0,90,0,0,0,0,0; Power(Watts): 100mW; Voltage-Supply(Max): 75V; Symbol: FRC0603F1501TS; LCSC Part Name: 1.5kΩ ±1% 100mW 厚膜电阻; SupplierPart: C2930050; ManufacturerPart: FRC0603F1501TS; Supplier Footprint: 0603; JLCPCB Part Class: Extended Part; Supplier: LCSC; ConvertToPcb: yes; FootprintName: R0603; ModelName: R0603; Type: 厚膜电阻; Value: 1.5kΩ; Tolerance: ±1%; Temperature Coefficient: ±100ppm/℃; Operating Temperature: -55℃~+155℃
R39 = rs-03k3300ft: 电阻类型:厚膜电阻;阻值:330Ω;精度:±1%;功率:100mW;工作电压:50V;温度系数:±100ppm/℃;; Manufacturer: FH(风华); Symbol: RS-03K331FT; AddInBom: yes; ModelId: fc143cca1e79419f9cd78b61e9279f08; ModelTransform: 31.8897,63.7794,0,90,0,0,0,0,0; Power(Watts): 100mW; Voltage-Supply(Max): 50V; LCSC Part Name: 厚膜电阻 330Ω ±1% 100mW; SupplierPart: C125768; ManufacturerPart: RS-03K3300FT; Supplier Footprint: 0603; JLCPCB Part Class: Extended Part; Datasheet: https://item.szlcsc.com/datasheet/RS-03K3300FT/137047.html; Supplier: LCSC; ConvertToPcb: yes; FootprintName: R0603; ModelName: R0603; Type: 厚膜电阻; Value: 330Ω; Tolerance: ±1%; Temperature Coefficient: ±100ppm/℃; Operating Temperature: -55℃~+155℃
R41 = frc1206j104 ts: 电阻类型:厚膜电阻;阻值:100kΩ;精度:±5%;功率:250mW;工作电压:200V;温度系数:±100ppm/℃;; Manufacturer: FOJAN(富捷); AddInBom: yes; ModelId: 89a1f13db2384da588040e0b3c55bf66; ModelName: R1206_L3.2-W1.6-H0.6; ModelTransform: 125.984,62.992,0,0,0,0,0,0,0; Value: 100kΩ; Tolerance: ±5%; Power(Watts): 250mW; Voltage-Supply(Max): 200V; Symbol: FRC1206J104 TS; LCSC Part Name: 100kΩ ±5% 250mW 厚膜电阻; SupplierPart: C2907421; ManufacturerPart: FRC1206J104 TS; Supplier Footprint: 1206; JLCPCB Part Class: Extended Part; Supplier: LCSC; ConvertToPcb: yes; FootprintName: R1206; Type: 厚膜电阻; Temperature Coefficient: ±100ppm/℃; Operating Temperature: -55℃~+155℃
R42 = frc1206j222 ts: 电阻类型:厚膜电阻;阻值:2.2kΩ;精度:±5%;功率:250mW;工作电压:200V;温度系数:±100ppm/℃;; Manufacturer: FOJAN(富捷); AddInBom: yes; ModelId: 89a1f13db2384da588040e0b3c55bf66; ModelName: R1206_L3.2-W1.6-H0.6; ModelTransform: 125.984,62.992,0,0,0,0,0,0,0; Value: 2.2kΩ; Tolerance: ±5%; Power(Watts): 250mW; Voltage-Supply(Max): 200V; Symbol: FRC1206J222 TS; LCSC Part Name: 2.2kΩ ±5% 250mW 厚膜电阻; SupplierPart: C2907443; ManufacturerPart: FRC1206J222 TS; Supplier Footprint: 1206; JLCPCB Part Class: Extended Part; Supplier: LCSC; ConvertToPcb: yes; FootprintName: R1206; Type: 厚膜电阻; Temperature Coefficient: ±100ppm/℃; Operating Temperature: -55℃~+155℃
R43 = frc0603f4702ts: 电阻类型:厚膜电阻;阻值:47kΩ;精度:±1%;功率:100mW;工作电压:75V;温度系数:±100ppm/℃;; Manufacturer: FOJAN(富捷); AddInBom: yes; ModelId: fc143cca1e79419f9cd78b61e9279f08; ModelTransform: 31.8897,63.7794,0,90,0,0,0,0,0; Power(Watts): 100mW; Voltage-Supply(Max): 75V; Symbol: FRC0603F4702TS; LCSC Part Name: 47kΩ ±1% 100mW 厚膜电阻; SupplierPart: C2907042; ManufacturerPart: FRC0603F4702TS; Supplier Footprint: 0603; JLCPCB Part Class: Extended Part; Supplier: LCSC; ConvertToPcb: yes; FootprintName: R0603; ModelName: R0603; Type: 厚膜电阻; Value: 47kΩ; Tolerance: ±1%; Temperature Coefficient: ±100ppm/℃; Operating Temperature: -55℃~+155℃
R50 = frc0805f4601ts: 电阻类型:厚膜电阻;阻值:4.6kΩ;精度:±1%;功率:125mW;工作电压:150V;温度系数:±100ppm/℃;; Manufacturer: FOJAN(富捷); AddInBom: yes; ModelId: 37a81e68749a4138bd2dfa6897b24b85; ModelName: R0805_L2.0-W1.3-H0.6; ModelTransform: 78.74,51.181,0,0,0,0,0,-0.0005,0; Value: 4.6kΩ; Tolerance: ±1%; Power(Watts): 125mW; Voltage-Supply(Max): 150V; Symbol: FRC0805F4601TS; LCSC Part Name: 4.6kΩ ±1% 125mW 厚膜电阻; SupplierPart: C2933447; ManufacturerPart: FRC0805F4601TS; Supplier Footprint: 0805; JLCPCB Part Class: Extended Part; Datasheet: https://item.szlcsc.com/datasheet/FRC0805F4601TS/3279549.html; Supplier: LCSC; ConvertToPcb: yes; FootprintName: R0805; Type: 厚膜电阻; Temperature Coefficient: ±100ppm/℃; Operating Temperature: -55℃~+155℃
U1 U3 = cj78m05_c9070: 输出类型:固定;工作电压:35V;输出电压:5V;输出电流:500mA;电源纹波抑制比(PSRR):80dB@(120Hz);输出极性:正极;; Manufacturer: CJ(江苏长电/长晶); AddInBom: yes; ModelId: 9aa45f6a769e40598a70aafe95110c28; ModelName: TO-252-3L-3P_L6.6-W6.1-H2.3-LS9.5-P4.6; ModelTransform: 259.842,372.80792,0,270,0,0,38.026,1.683,0; Output Type: 固定; Voltage - Supply: 35V; Output Voltage: 5V; Output Current: 500mA; Voltage Dropout: 2V@(350mA); standby current: 4.2mA; Output Configuration: 正极; Number of Outputs: 1; Symbol: CJ78M05_C9070; LCSC Part Name: 输入35V 输出5V 500mA; SupplierPart: C9070; ManufacturerPart: CJ78M05; Supplier Footprint: TO-252-2L; JLCPCB Part Class: Extended Part; Datasheet: https://item.szlcsc.com/datasheet/CJ78M05/9591.html; Supplier: LCSC; ConvertToPcb: yes; FootprintName: TO-252-3_L6.5-W5.8-P4.58-TL; Power Supply Rejection Ratio (PSRR): 80dB@(120Hz); Noise: -; Operating Temperature: -40℃~+125℃@(Tj)
U2 = m0518ld2ae_1: CPU内核:ARM Cortex-M0;CPU最大主频:50MHz;CPU位数:32 Bit;; Manufacturer: NUVOTON(新唐); AddInBom: yes; ModelId: 093be70396ff421eb2cdb946d5311efc; ModelName: LQFP-48_L7.0-W7.0-H1.4-LS9.0-P0.50; ModelTransform: 354.331,354.331,0,0,0,0,0,0,0; CPU Maximum Speed: 50MHz; Core Size: 32 Bit; Program Storage Size: 68KB; Program Memory Type: FLASH; RAM Size: 8KB; Number of I/O: 42; ADC (Bit): 12bit; Oscillator Type: 内置; Voltage - Supply: 2.5V~5.5V; Symbol: M0518LD2AE; LCSC Part Name: NuMicro M0518系列; SupplierPart: C272862; ManufacturerPart: M0518LD2AE; Supplier Footprint: LQFP-48(7x7); JLCPCB Part Class: Extended Part; Datasheet: https://item.szlcsc.com/datasheet/M0518LD2AE/261248.html; Supplier: LCSC; ConvertToPcb: yes; FootprintName: LQFP-48_L7.0-W7.0-P0.50-LS9.0-BL; CPU Core: ARM Cortex-M0; EEPROM: -; Operating Temperature: -40℃~+105℃
U4 = b1212s-2wr3_c2992389: B1212S-2WR3是专门针对板上电源系统中需要产生一组与输入电源隔离的电压的应用场合而设计的。该产品适用于：1）输入电源的电压比较稳定（电压变化范围±10%Vin）；2）输入输出之间要求隔离（隔离电压≤1500VDC）；3）对输出电压稳定度要求不高；4）典型应用：纯数字电路场合，一般低频模拟电路场合，继电器驱动电路，数据交换电路场合等特点：定电压输入，隔离非稳压输出，2W，隔离电压：1500VDC，效率：高达 84%。; Manufacturer: YLPTEC(易川); AddInBom: yes; ModelId: 1296e1ddb23741649fe3427605259121; ModelTransform: 771.652,277.9522,0,0,0,0,50.197,-102.362,-157.48; Number of Channels: 1; Output Power: 2W; Voltage - Supply: 10.8V~13.2V; Conversion Efficiency: 86%; Output Voltage: 12V; Output Current(Max): 166mA; Capacitive Load(Max): 560uF; Isolation Voltage(Vrms): 1.5kV; Value: 100kHz; Symbol: B1212S-2WR3_C2992389; LCSC Part Name: 2W定电压输入隔离非稳压单路输出DC/DC电源模块; SupplierPart: C2992389; ManufacturerPart: B1212S-2WR3; Supplier Footprint: SIP,19.5x7mm; JLCPCB Part Class: Extended Part; Datasheet: https://item.szlcsc.com/datasheet/B1212S-2WR3/3456892.html; Supplier: LCSC; ConvertToPcb: yes; FootprintName: PWRM-TH_4P-L19.7-W7.1-P2.54_DEXU_NN2-12S05CN; ModelName: PWRM-TH_4P-L19.7-W7.1-P2.54_DEXU_NN2-12S05CN; Function: -; Features: 短路保护；低功耗; Operating Temperature: -40℃~+85℃; Length: 19.5mm; Width: 7mm; Height: 10mm
U5 = cd4046bm/tr: 接口类型:-;最大输出频率:1.3MHz;输出通道数:2;; Manufacturer: HGSEMI(华冠); AddInBom: yes; ModelId: ed96d47c1e844792b3e705d722a1a1fa; ModelTransform: 389.763,236.22,0,0,0,0,0,0,0; Output Frequency(Max): 1.3MHz; Voltage - Supply: 3V~15V; Number of Outputs: 2; Clock/Oscillator: 外置; Symbol: CD4046BM/TR; LCSC Part Name: 微功率锁相环; SupplierPart: C7432285; ManufacturerPart: CD4046BM/TR; Supplier Footprint: SOP-16; JLCPCB Part Class: Extended Part; Datasheet: https://item.szlcsc.com/datasheet/CD4046BM%252FTR/8436734.html; Supplier: LCSC; ConvertToPcb: yes; FootprintName: SOP-16_L9.9-W3.9-P1.27-LS6.0-BL; ModelName: SOP-16_L9.9-W3.9-P1.27-LS6.0-BL; Interface: -; Operating Temperature: -40℃~+85℃; Period Jitter: -; Cycle-to-Cycle Jitter: -; Phase Jitter: -; Phase Offset: -; Input: -; Output: -; Features: -
U6 = lm358dr2g: 放大器数:2;轨到轨:-;增益带宽积(GBW):-;输入失调电压(Vos):7mV;压摆率(SR):-;输入偏置电流(Ib):150nA;; Manufacturer: onsemi(安森美); AddInBom: yes; ModelId: 7abc64c95a1a4a04a4ef38f9097c870b; ModelTransform: 192.913,236.22,0,0,0,0,0,0,0; Number of Channels: 2; Maximum Power Supply Range (Vdd-Vss): 32V; Vos - Input Offset Voltage: 7mV; Input Offset Voltage Drift(Vos TC): 10uV/℃; Ib - Input Bias Current: 150nA; Input Offset Current(Ios): 5nA; Common Mode Rejection Ratio(CMRR): 70dB; Input offset current drift(Ios TC): 10pA/℃; Quiescent Current: 700uA; Output Current: 40mA; Single supply: 3V~32V; Dual Supply: -16V~16V; Symbol: LM358DR2G; LCSC Part Name: 单电源双运算放大器; SupplierPart: C7950; ManufacturerPart: LM358DR2G; Supplier Footprint: SOIC-8; JLCPCB Part Class: Basic Part; Datasheet: https://item.szlcsc.com/datasheet/LM358DR2G/8427.html; Supplier: LCSC; ConvertToPcb: yes; FootprintName: SOIC-8_L5.0-W4.0-P1.27-LS6.0-BL; ModelName: SOIC-8_L5.0-W4.0-P1.27-LS6.0-BL; Rail to Rail: -; Gain Bandwidth Product: -; Slew Rate: -; Input Voltage Noise Density: -; Operating Temperature: 0℃~+70℃; Features: -